# Altium schematic sheet PFC-Sheet.SchDoc (part 4 of 4)
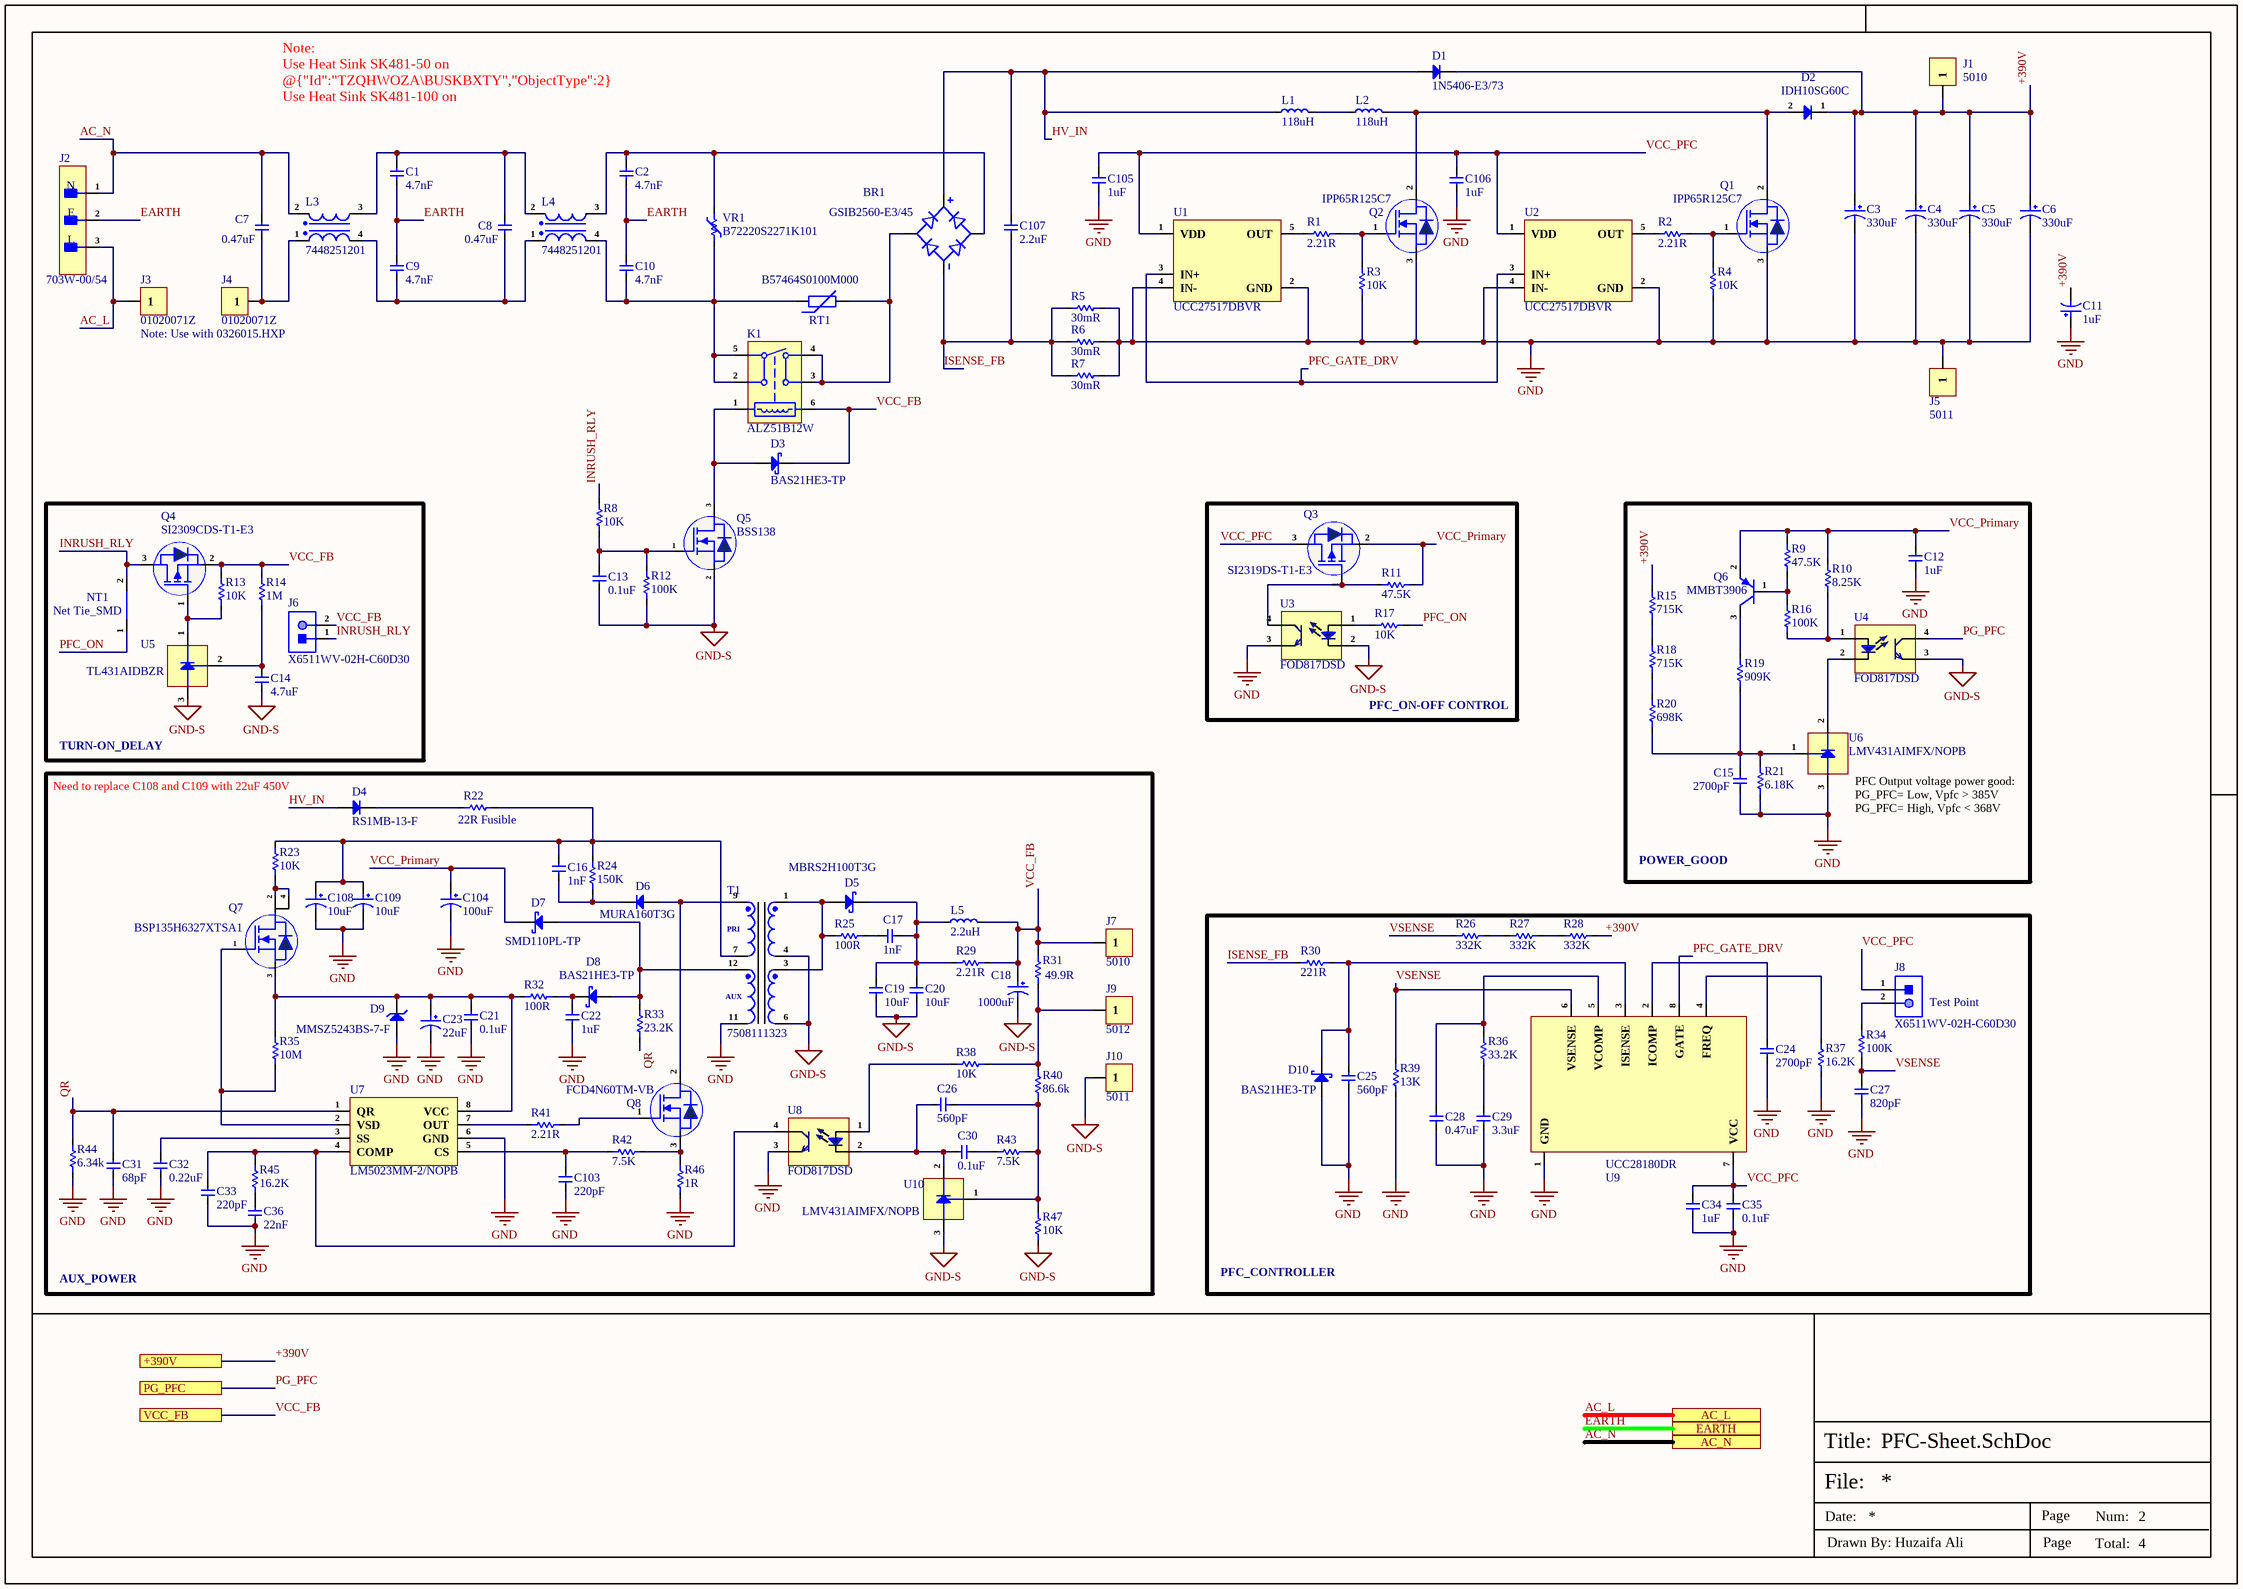
[diagram p3: PFC-Sheet.SchDoc]

## Library data of the parts (continued)
R36 = RC0603FR-0733K2L: RES 33.2K OHM 1% 1/10W 0603; Manufacturer: Yageo; Resistance: 33.2kR; Power Rating: 100mW; Voltage Rating: 50V; Temperature Coefficient: 100ppm/°C; Supplier 1: Digi-Key; Manufacturer Part Number: RC0603FR-0733K2L; RoHS: Yes; Category: Chip SMD Resistors; Stock 1: 1293262; Pricing 1: 1=0.10000, 10=0.02300, 100=0.00930, 1000=0.00417, 2500=0.00362 (USD); Mount: Surface Mount; Case/Package: 0603; Case Code (Imperial): 0603; Case Code (Metric): 1608; Size Code: 0603; Min Operating Temperature: -55°C; Max Operating Temperature: 155°C; Tolerance: 1%; Packaging: Tape and Reel; Termination: SMD/SMT; Resistor Type: Thick Film; Voltage Rating (DC): 50V; Features: Moisture Resistant; Series: RC; Max Power Dissipation: 100mW; Number of Terminations: 2; Construction: Rectangular; Technology: THICK FILM; Length: 1.6mm; Height: 0.45mm; Depth: 0.8mm; Military Standard: Not; Lead Free: Lead Free; RoHS Compliant: Yes; ComponentLink1URL: https://datasheet.ciiva.com/11808/0900766b80f96399-11808316.pdf?src-supplier=RSComponents; ComponentLink1Description: https://datasheet.ciiva.com/11808/0900766b80f96399-11808316.pdf?src-supplier=RSComponents; Supplier Part Number 1: 311-33.2KHRCT-ND; LCSC Part Number: C185338
R37 R45 = CRCW060316K2FKEA: RES SMD 16.2K OHM 1% 1/10W 0603; Manufacturer: Vishay; Item Type: Resistors; Voltage Rating (DC): 75V; Supplier: Mouser; LCSC Part Number: C844531; Manufacturer Part Number: CRCW060316K2FKEA; RoHS: Yes; Stock: 14717; Pricing: 1=0.1, 10=0.016, 50=0.016, 100=0.01, 1000=0.008, 5000=0.005, 10000=0.004, 50000=0.003 (USD); Lead Free: 5697LeadFree; ComponentLink1URL: https://datasheet.ciiva.com/11810/0900766b80d98afc-11810432.pdf?src-supplier=Rs; ComponentLink1Description: https://datasheet.ciiva.com/11810/0900766b80d98afc-11810432.pdf?src-supplier=Rs; ComponentLink2URL: https://datasheet.ciiva.com/2513/dcrcwe3-2513620.pdf?src-supplier=Digikey; ComponentLink2Description: https://datasheet.ciiva.com/2513/dcrcwe3-2513620.pdf?src-supplier=Digikey; ComponentLink3URL: https://datasheet.ciiva.com/2513/dcrcwe3-2513621.pdf?src-supplier=Digikey; ComponentLink3Description: https://datasheet.ciiva.com/2513/dcrcwe3-2513621.pdf?src-supplier=Digikey; ComponentLink4URL: https://datasheet.ciiva.com/2513/dcrcwe3-2513622.pdf?src-supplier=Digikey; ComponentLink4Description: https://datasheet.ciiva.com/2513/dcrcwe3-2513622.pdf?src-supplier=Digikey; ComponentLink5URL: https://datasheet.ciiva.com/3257/dcrcwe3-3257083.pdf?src-supplier=Avnet; ComponentLink5Description: https://datasheet.ciiva.com/3257/dcrcwe3-3257083.pdf?src-supplier=Avnet; ComponentLink6URL: https://datasheet.ciiva.com/16204/dcrcwe3-16204298.pdf?src-supplier=Future+Electronics; ComponentLink6Description: https://datasheet.ciiva.com/16204/dcrcwe3-16204298.pdf?src-supplier=Future+Electronics; ComponentLink7URL: https://datasheet.ciiva.com/7663/1697337-7663893.pdf?src-supplier=Element14; ComponentLink7Description: https://datasheet.ciiva.com/7663/1697337-7663893.pdf?src-supplier=Element14; ComponentLink8URL: https://datasheet.ciiva.com/7173/1635184-7173002.pdf?src-supplier=Newark; ComponentLink8Description: https://datasheet.ciiva.com/7173/1635184-7173002.pdf?src-supplier=Newark; ComponentLink9URL: https://datasheet.ciiva.com/22702/1697337-22702885.pdf?src-supplier=Element14; ComponentLink9Description: https://datasheet.ciiva.com/22702/1697337-22702885.pdf?src-supplier=Element14; ComponentLink10URL: https://datasheet.ciiva.com/16787/70201119-16787821.pdf?src-supplier=Allied+Electronics; ComponentLink10Description: https://datasheet.ciiva.com/16787/70201119-16787821.pdf?src-supplier=Allied+Electronics; ComponentLink11URL: https://datasheet.ciiva.com/22869/70201119-22869438.pdf?src-supplier=Allied+Electronics; ComponentLink11Description: https://datasheet.ciiva.com/22869/70201119-22869438.pdf?src-supplier=Allied+Electronics; ComponentLink12URL: https://datasheet.ciiva.com/5548/dcrcwe3-109170-5548517.pdf?src-supplier=Mouser; ComponentLink12Description: https://datasheet.ciiva.com/5548/dcrcwe3-109170-5548517.pdf?src-supplier=Mouser; ComponentLink13URL: https://datasheet.ciiva.com/7792/125364-7792056.pdf?src-supplier=Element14; ComponentLink13Description: https://datasheet.ciiva.com/7792/125364-7792056.pdf?src-supplier=Element14
R39 = 0603WAF1302T5E: 100mW Thick Film Resistors ±100ppm/℃ ±1% 13kΩ 0603 Chip Resistor - Surface Mount ROHS; Manufacturer: UNI-ROYAL; Manufacturer Part Number: 0603WAF1302T5E; Package: 0603; LCSC Part Number: C22797; Item Type: Resistor; ComponentLink1Description: LCSC; ComponentLink1URL: https://www.lcsc.com/product-detail/Chip-Resistor-Surface-Mount_UNI-ROYAL-Uniroyal-Elec-0603WAF1302T5E_C22797.html
R40 = CRCW060386K6FKEA: RES SMD 86.6K OHM 1% 1/10W 0603; Manufacturer: Vishay; Item Type: Resistors; Value: 86.6kR; Power Rating: 100mW; Voltage Rating: 75V; Temperature Coefficient: 100ppm/°C; Supplier: Mouser; LCSC Part Number: C2076678; Manufacturer Part Number: CRCW060386K6FKEA; RoHS: Yes; Stock: 21228; Pricing: 1=0.1, 10=0.017, 50=0.017, 100=0.01, 1000=0.008, 10000=0.004 (USD); Case/Package: 0603; Pins: 2; Weight: 7.1E-05oz; Case Code (Metric): 1608; Case Code (Imperial): 0603; Contact Plating: Tin; Min Operating Temperature: -55°C; Max Operating Temperature: 155°C; Tolerance: 1%; Packaging: Tape and Reel; Package Quantity: 5000; Number of Terminations: 2; Termination: SMD/SMT; Max Power Dissipation: 100mW; Features: Automotive AEC-Q200; Series: CRCW; Resistor Type: Thick Film; Construction: Rectangular; Technology: THICK FILM; Resistance Tolerance: 1%; Voltage Rating (DC): 75V; Length: 1.55mm; Width: 0.85mm; Height: 0.45mm; Depth: 0.85mm; Ratings: AEC-Q200; Radiation Hardening: No; RoHS Compliant: Yes; Lead Free: 5697LeadFree; Military Standard: Not; Reach SVHC Compliant: Unknown; ComponentLink1URL: https://datasheet.ciiva.com/11812/0900766b80d98afc-11812181.pdf?src-supplier=Rs; ComponentLink1Description: https://datasheet.ciiva.com/11812/0900766b80d98afc-11812181.pdf?src-supplier=Rs; ComponentLink2URL: https://datasheet.ciiva.com/2466/dcrcwe3-2466293.pdf?src-supplier=Digikey; ComponentLink2Description: https://datasheet.ciiva.com/2466/dcrcwe3-2466293.pdf?src-supplier=Digikey; ComponentLink3URL: https://datasheet.ciiva.com/16779/70201119-16779662.pdf?src-supplier=Allied+Electronics; ComponentLink3Description: https://datasheet.ciiva.com/16779/70201119-16779662.pdf?src-supplier=Allied+Electronics; ComponentLink4URL: https://datasheet.ciiva.com/22869/70201119-22869020.pdf?src-supplier=Allied+Electronics; ComponentLink4Description: https://datasheet.ciiva.com/22869/70201119-22869020.pdf?src-supplier=Allied+Electronics; ComponentLink5URL: https://datasheet.ciiva.com/5549/dcrcwe3-109170-5549565.pdf?src-supplier=Mouser; ComponentLink5Description: https://datasheet.ciiva.com/5549/dcrcwe3-109170-5549565.pdf?src-supplier=Mouser; ComponentLink6URL: https://datasheet.ciiva.com/2466/dcrcwe3-2466294.pdf?src-supplier=Digikey; ComponentLink6Description: https://datasheet.ciiva.com/2466/dcrcwe3-2466294.pdf?src-supplier=Digikey; ComponentLink7URL: https://datasheet.ciiva.com/2466/dcrcwe3-2466295.pdf?src-supplier=Digikey; ComponentLink7Description: https://datasheet.ciiva.com/2466/dcrcwe3-2466295.pdf?src-supplier=Digikey; ComponentLink8URL: https://datasheet.ciiva.com/3257/dcrcwe3-3257941.pdf?src-supplier=Avnet; ComponentLink8Description: https://datasheet.ciiva.com/3257/dcrcwe3-3257941.pdf?src-supplier=Avnet; ComponentLink9URL: https://datasheet.ciiva.com/8337/dcrcwe3-8337688.pdf?src-supplier=Avnet; ComponentLink9Description: https://datasheet.ciiva.com/8337/dcrcwe3-8337688.pdf?src-supplier=Avnet; ComponentLink10URL: https://datasheet.ciiva.com/16435/dcrcw-16435963.pdf?src-supplier=Future+Electronics; ComponentLink10Description: https://datasheet.ciiva.com/16435/dcrcw-16435963.pdf?src-supplier=Future+Electronics
R42 = CRCW06037K50FKEA: RES SMD 7.5K OHM 1% 1/10W 0603; Manufacturer: Vishay; Item Type: Resistor; Value: 7.5kR; Temperature Coefficient: 100ppm/°C; Max Power Dissipation: 100mW; Voltage Rating: 75V; Supplier: Mouser; LCSC Part Number: C844808; Manufacturer Part Number: CRCW06037K50FKEA; RoHS: Yes; Stock: 12180; Pricing: 1=0.1, 10=0.017, 50=0.017, 100=0.01, 1000=0.008, 10000=0.004 (USD); Case/Package: 0603; Case Code (Metric): 1608; Case Code (Imperial): 0603; Contact Plating: Tin; Weight: 7.1E-05oz; Min Operating Temperature: -55°C; Max Operating Temperature: 155°C; Tolerance: 1%; Packaging: Tape and Reel; Package Quantity: 5000; Number of Terminations: 2; Features: Automotive AEC-Q200; Series: CRCW; Resistor Type: Thick Film; Power Rating: 100mW; Termination: SMD/SMT; Technology: THICK FILM; Construction: Rectangular; Resistance Tolerance: 1%; Voltage Rating (DC): 75V; Length: 1.55mm; Width: 0.85mm; Height: 0.45mm; Depth: 0.85mm; Ratings: AEC-Q200; Radiation Hardening: No; Lead Free: 5697LeadFree; RoHS Compliant: Yes; Military Standard: Not; Reach SVHC Compliant: Unknown; ComponentLink1URL: https://datasheet.ciiva.com/11810/0900766b80d98afc-11810928.pdf?src-supplier=Rs; ComponentLink1Description: https://datasheet.ciiva.com/11810/0900766b80d98afc-11810928.pdf?src-supplier=Rs; ComponentLink2URL: https://datasheet.ciiva.com/26314/fld-crcw-e3-data-en-26314746.pdf?src-supplier=Distrelec; ComponentLink2Description: https://datasheet.ciiva.com/26314/fld-crcw-e3-data-en-26314746.pdf?src-supplier=Distrelec; ComponentLink3URL: https://datasheet.ciiva.com/7679/1697337-7679146.pdf?src-supplier=Element14; ComponentLink3Description: https://datasheet.ciiva.com/7679/1697337-7679146.pdf?src-supplier=Element14; ComponentLink4URL: https://datasheet.ciiva.com/2465/dcrcwe3-2465715.pdf?src-supplier=Digikey; ComponentLink4Description: https://datasheet.ciiva.com/2465/dcrcwe3-2465715.pdf?src-supplier=Digikey; ComponentLink5URL: https://datasheet.ciiva.com/2465/dcrcwe3-2465716.pdf?src-supplier=Digikey; ComponentLink5Description: https://datasheet.ciiva.com/2465/dcrcwe3-2465716.pdf?src-supplier=Digikey; ComponentLink6URL: https://datasheet.ciiva.com/2465/dcrcwe3-2465714.pdf?src-supplier=Digikey; ComponentLink6Description: https://datasheet.ciiva.com/2465/dcrcwe3-2465714.pdf?src-supplier=Digikey; ComponentLink7URL: https://datasheet.ciiva.com/16774/70201119-16774541.pdf?src-supplier=Allied+Electronics; ComponentLink7Description: https://datasheet.ciiva.com/16774/70201119-16774541.pdf?src-supplier=Allied+Electronics; ComponentLink8URL: https://datasheet.ciiva.com/5544/dcrcwe3-109170-5544283.pdf?src-supplier=Mouser; ComponentLink8Description: https://datasheet.ciiva.com/5544/dcrcwe3-109170-5544283.pdf?src-supplier=Mouser; ComponentLink9URL: https://datasheet.ciiva.com/3257/dcrcwe3-3257903.pdf?src-supplier=Avnet; ComponentLink9Description: https://datasheet.ciiva.com/3257/dcrcwe3-3257903.pdf?src-supplier=Avnet; ComponentLink10URL: https://datasheet.ciiva.com/16389/dcrcw-16389894.pdf?src-supplier=Future+Electronics; ComponentLink10Description: https://datasheet.ciiva.com/16389/dcrcw-16389894.pdf?src-supplier=Future+Electronics; ComponentLink11URL: https://datasheet.ciiva.com/3257/dcrcwe3-3257902.pdf?src-supplier=Avnet; ComponentLink11Description: https://datasheet.ciiva.com/3257/dcrcwe3-3257902.pdf?src-supplier=Avnet
R43 = RT0603BRD077K5L: RES SMD 7.5K OHM 0.1% 1/10W 0603; Manufacturer: Yageo; Resistance: 7.5kR; Power Rating: 100mW; Voltage Rating: 75V; Temperature Coefficient: 25ppm/°C; Voltage Rating (DC): 50V; Item Type: Resistor; Supplier 1: Avnet; Manufacturer Part Number: RT0603BRD077K5L; RoHS: Yes; Category: Chip SMD Resistors; Stock 1: 30000; Pricing 1: 5000=0.02327, 10000=0.02294, 20000=0.02227 (USD); Case/Package: 0603; Case Code (Imperial): 0603; Case Code (Metric): 1608; Weight: 7.1E-05oz; Contact Plating: Tin,Matte; Size Code: 0603; Min Operating Temperature: -55°C; Max Operating Temperature: 125°C; Package Quantity: 5000; Packaging: Tape and Reel; Tolerance: 0.1%; Resistor Type: Thin Film; Termination: SMD/SMT; Number of Terminations: 2; Max Power Dissipation: 100mW; Features: Moisture Resistant; Series: RT; Length: 0.063inch; Width: 0.8mm; Height: 0.022inch; Radiation Hardening: No; Lead Free: Lead Free; RoHS Compliant: Yes; ComponentLink1URL: https://datasheet.ciiva.com/8891/pyu-rt-1-to-0-05-rohs-l-4-8891914.pdf?src-supplier=Avnet; ComponentLink1Description: https://datasheet.ciiva.com/8891/pyu-rt-1-to-0-05-rohs-l-4-8891914.pdf?src-supplier=Avnet; Supplier Part Number 1: RT0603BRD077K5L; LCSC Part Number: C728597
R44 = RT0603BRD076K34L: RES SMD 6.34KOHM 0.1% 1/10W 0603; Manufacturer: Yageo; Resistance: 6.34kR; Power Rating: 100mW; Voltage Rating: 75V; Temperature Coefficient: 25ppm/°C; Voltage Rating (DC): 50V; Item Type: Resistor; Supplier 1: Digi-Key; Manufacturer Part Number: RT0603BRD076K34L; RoHS: Yes; Category: Chip SMD Resistors; Stock 1: 15385; Pricing 1: 1=0.34000, 10=0.28800, 100=0.11260, 500=0.06812, 1000=0.04716, 2500=0.04322 (USD); Case/Package: 0603; Case Code (Imperial): 0603; Case Code (Metric): 1608; Weight: 7.1E-05oz; Min Operating Temperature: -55°C; Max Operating Temperature: 125°C; Packaging: Tape and Reel; Tolerance: 0.1%; Termination: SMD/SMT; Series: RT; Length: 1.6mm; Width: 0.8mm; Height: 0.45mm; Lead Free: Lead Free; RoHS Compliant: Yes; ComponentLink1URL: https://datasheet.ciiva.com/12811/pyu-rt-1-to-0-05-rohs-l-4-12811741.pdf?src-supplier=Mouser; ComponentLink1Description: https://datasheet.ciiva.com/12811/pyu-rt-1-to-0-05-rohs-l-4-12811741.pdf?src-supplier=Mouser; LCSC Part Number: C861532; Supplier Part Number 1: YAG4590CT-ND
R46 = CRCW12061R00FKEA: RES SMD 1 OHM 1% 1/4W 1206; Manufacturer: Vishay; Item Type: Resistor; Voltage Rating (DC): 200V; Supplier: Mouser; LCSC Part Number: C844870; Manufacturer Part Number: CRCW12061R00FKEA; RoHS: Yes; Stock: 28572; Pricing: 1=0.12, 10=0.037, 50=0.037, 100=0.024, 1000=0.021, 10000=0.013 (USD); Lead Free: 5697LeadFree; ComponentLink1URL: https://datasheet.ciiva.com/11811/0900766b80d98b5e-11811443.pdf?src-supplier=Rs; ComponentLink1Description: https://datasheet.ciiva.com/11811/0900766b80d98b5e-11811443.pdf?src-supplier=Rs; ComponentLink2URL: https://datasheet.ciiva.com/5548/dcrcwe3-109170-5548686.pdf?src-supplier=Mouser; ComponentLink2Description: https://datasheet.ciiva.com/5548/dcrcwe3-109170-5548686.pdf?src-supplier=Mouser; ComponentLink3URL: https://datasheet.ciiva.com/16724/70201119-16724205.pdf?src-supplier=Allied+Electronics; ComponentLink3Description: https://datasheet.ciiva.com/16724/70201119-16724205.pdf?src-supplier=Allied+Electronics; ComponentLink4URL: https://datasheet.ciiva.com/7841/1720486-7841869.pdf?src-supplier=Element14; ComponentLink4Description: https://datasheet.ciiva.com/7841/1720486-7841869.pdf?src-supplier=Element14; ComponentLink5URL: https://datasheet.ciiva.com/16295/dcrcwe3-16295679.pdf?src-supplier=Future+Electronics; ComponentLink5Description: https://datasheet.ciiva.com/16295/dcrcwe3-16295679.pdf?src-supplier=Future+Electronics; ComponentLink6URL: https://datasheet.ciiva.com/2468/dcrcwe3-2468799.pdf?src-supplier=Digikey; ComponentLink6Description: https://datasheet.ciiva.com/2468/dcrcwe3-2468799.pdf?src-supplier=Digikey; ComponentLink7URL: https://datasheet.ciiva.com/2468/dcrcwe3-2468800.pdf?src-supplier=Digikey; ComponentLink7Description: https://datasheet.ciiva.com/2468/dcrcwe3-2468800.pdf?src-supplier=Digikey; ComponentLink8URL: https://datasheet.ciiva.com/2468/dcrcwe3-2468801.pdf?src-supplier=Digikey; ComponentLink8Description: https://datasheet.ciiva.com/2468/dcrcwe3-2468801.pdf?src-supplier=Digikey; ComponentLink9URL: https://datasheet.ciiva.com/9109/dcrcwe3-9109199.pdf?src-supplier=Avnet; ComponentLink9Description: https://datasheet.ciiva.com/9109/dcrcwe3-9109199.pdf?src-supplier=Avnet
RT1 = B57464S0100M000: ICL 10 OHM 20% 8A 26MM; Manufacturer: TDK EPCOS; Item Type: THermistor; Supplier: Digikey; Supplier Part Number: 495-4111-ND; Manufacturer Part Number: B57464S0100M000; RoHS: Yes; Pricing: 1=5.3, 5=4.42, 10=4.087, 50=3.4022, 200=2.9015, 400=2.6778, 600=2.5544, 1000=2.50812 (USD); ComponentLink1URL: https://datasheet.ciiva.com/46435/1795241-46435759.pdf?src-supplier=Element14; ComponentLink1Description: https://datasheet.ciiva.com/46435/1795241-46435759.pdf?src-supplier=Element14; ComponentLink2URL: https://datasheet.ciiva.com/7982/1795241-7982525.pdf?src-supplier=Element14; ComponentLink2Description: https://datasheet.ciiva.com/7982/1795241-7982525.pdf?src-supplier=Element14
T1 = 7508111323: XFMR FLYBACK AC/DC CONV 2MH TH; Manufacturer: Wurth Electronics; Item Type: Transformer; Supplier: Digikey; Supplier Part Number: 732-7508111323CT-ND; Manufacturer Part Number: 7508111323; RoHS: No; Stock: 130; Pricing: 1=6.34, 25=6.3092, 50=5.735 (USD)
U1 U2 = UCC27517DBVR: IC GATE DRVR LOW-SIDE SOT23-5; Manufacturer: Texas Instruments; Operating Supply Voltage: 12V; Number of Outputs: 1; Max Supply Voltage: 18V; Min Supply Voltage: 4.5V; Rise Time: 22ns; Propagation Delay: 30ns; Output Current: 4A; Channel Type: Single; Fall Time: 11ns; Supplier: Mouser; LCSC Part Number: C99395; Manufacturer Part Number: UCC27517DBVR; RoHS: Yes; Item Type: IC; Stock: 71094; Pricing: 1=0.77, 10=0.646, 50=0.646, 100=0.501, 1000=0.346, 10000=0.29 (USD); Mounting Technology: Surface Mount; Case/Package: SOT-23-5; Pins: 5; Min Operating Temperature: -40°C; Max Operating Temperature: 140°C; Packaging: Tape and Reel; Package Quantity: 3000; Max Output current: 4A; Number of Drivers: 1; Turn-On Delay Time: 30ns; Number of Channels: 1; Series: -; Length: 2.9mm; Width: 1.6mm; Height: 1.45mm; Thickness: 1.2mm; Radiation Hardening: No; Lead Free: Lead Free; RoHS Compliant: Yes; ComponentLink1URL: http://components.arrow.com/part/dataview/52526194S5756N7713?src-supplier=Arrow+Electronics; ComponentLink1Description: http://components.arrow.com/part/dataview/52526194S5756N7713?src-supplier=Arrow+Electronics; ComponentLink2URL: http://www.ti.com/lit/ds/symlink/ucc27517.pdf?src-supplier=Avnet; ComponentLink2Description: http://www.ti.com/lit/ds/symlink/ucc27517.pdf?src-supplier=Avnet; ComponentLink3URL: http://www.ti.com/lit/ds/symlink/ucc27517.pdf?src-supplier=Digikey; ComponentLink3Description: http://www.ti.com/lit/ds/symlink/ucc27517.pdf?src-supplier=Digikey; ComponentLink4URL: http://www.ti.com/lit/gpn/ucc27517?src-supplier=Mouser; ComponentLink4Description: http://www.ti.com/lit/gpn/ucc27517?src-supplier=Mouser; ComponentLink5URL: http://www.ti.com/general/docs/lit/getliterature.tsp?genericPartNumber=UCC27516&&fileType=pdf&src-supplier=Avnet; ComponentLink5Description: http://www.ti.com/general/docs/lit/getliterature.tsp?genericPartNumber=UCC27516&&fileType=pdf&src-supplier=Avnet; ComponentLink6URL: https://www.verical.com/server-webapp/html/getDatasheet?partID=482756&src-supplier=Verical; ComponentLink6Description: https://www.verical.com/server-webapp/html/getDatasheet?partID=482756&src-supplier=Verical
U3 U4 U8 = FOD817DSD: OPTOISOLATOR 5KV TRANSISTOR 4SMD; Manufacturer: ON Semiconductor / Fairchild; Item Type: Optocouplers; Supplier: Future Electronics; LCSC Part Number: C241832; Manufacturer Part Number: FOD817DSD; RoHS: Yes; Stock: 194000; Pricing: 1000=0.153, 3000=0.148, 5000=0.146, 15000=0.142, 25000=0.138 (USD); ComponentLink1URL: https://datasheet.ciiva.com/2085/fod817-2085872.pdf?src-supplier=Digikey; ComponentLink1Description: https://datasheet.ciiva.com/2085/fod817-2085872.pdf?src-supplier=Digikey; ComponentLink2URL: https://datasheet.ciiva.com/30520/2018343-30520890.pdf?src-supplier=Jameco; ComponentLink2Description: https://datasheet.ciiva.com/30520/2018343-30520890.pdf?src-supplier=Jameco; ComponentLink3URL: https://datasheet.ciiva.com/15118/getdatasheetpartid-110546-15118613.pdf?src-supplier=Verical; ComponentLink3Description: https://datasheet.ciiva.com/15118/getdatasheetpartid-110546-15118613.pdf?src-supplier=Verical; ComponentLink4URL: https://datasheet.ciiva.com/2085/fod817d-2085873.pdf?src-supplier=Digikey; ComponentLink4Description: https://datasheet.ciiva.com/2085/fod817d-2085873.pdf?src-supplier=Digikey; ComponentLink5URL: https://datasheet.ciiva.com/2085/fod817d-2085874.pdf?src-supplier=Digikey; ComponentLink5Description: https://datasheet.ciiva.com/2085/fod817d-2085874.pdf?src-supplier=Digikey; ComponentLink6URL: https://datasheet.ciiva.com/8095/fod817d-8095134.pdf?src-supplier=Avnet; ComponentLink6Description: https://datasheet.ciiva.com/8095/fod817d-8095134.pdf?src-supplier=Avnet; ComponentLink7URL: https://datasheet.ciiva.com/17277/fod817-17277350.pdf?src-supplier=Future+Electronics; ComponentLink7Description: https://datasheet.ciiva.com/17277/fod817-17277350.pdf?src-supplier=Future+Electronics
U5 = TL431AIDBZR: IC VREF SHUNT ADJ 1% SOT23-3; Manufacturer: Texas Instruments; Output Voltage: 36V; Number of Channels: 1; Cathode Current: 700uA; Output Current: 100mA; Reference Type: Shunt,Adjustable; Min Input Voltage: 2.495V; Max Supply Voltage: 37V; Temperature Coefficient: 92ppm/°C; Output Type: Adjustable; Supplier: Mouser; LCSC Part Number: C23892; Manufacturer Part Number: TL431AIDBZR; RoHS: Yes; Item Type: IC; Stock: 732677; Pricing: 1=0.25, 10=0.142, 50=0.142, 100=0.099, 1000=0.095, 10000=0.08 (USD); Case/Package: SOT-23; Pins: 3; Min Operating Temperature: -40°C; Max Operating Temperature: 125°C; Packaging: Tape and Reel; Package Quantity: 1; Tolerance: 1%; Reference Voltage: 36V; Series: -; Max Output current: 100mA; Min Output Voltage: 2.495V; Max Output Voltage: 36V; Radiation Hardening: No; Lead Free: Lead Free; RoHS Compliant: Yes; Reach SVHC Compliant: No; ComponentLink1URL: https://datasheet.ciiva.com/3235/tl432b-3235600.pdf?src-supplier=Avnet; ComponentLink1Description: https://datasheet.ciiva.com/3235/tl432b-3235600.pdf?src-supplier=Avnet; ComponentLink2URL: https://datasheet.ciiva.com/15148/getdatasheetpartid-171576-15148968.pdf?src-supplier=Verical; ComponentLink2Description: https://datasheet.ciiva.com/15148/getdatasheetpartid-171576-15148968.pdf?src-supplier=Verical; ComponentLink3URL: https://datasheet.ciiva.com/41462/001014548-da-01-en-ic-vref-shunt-prec-tl431aidbzr-sot-3-tid-41462400.pdf?src-supplier=Conrad; ComponentLink3Description: https://datasheet.ciiva.com/41462/001014548-da-01-en-ic-vref-shunt-prec-tl431aidbzr-sot-3-tid-41462400.pdf?src-supplier=Conrad; ComponentLink4URL: https://datasheet.ciiva.com/46397/1887475-46397705.pdf?src-supplier=Element14; ComponentLink4Description: https://datasheet.ciiva.com/46397/1887475-46397705.pdf?src-supplier=Element14; ComponentLink5URL: https://datasheet.ciiva.com/2006/tl431a-2006188.pdf?src-supplier=Digikey; ComponentLink5Description: https://datasheet.ciiva.com/2006/tl431a-2006188.pdf?src-supplier=Digikey; ComponentLink6URL: https://datasheet.ciiva.com/2006/tl431a-2006187.pdf?src-supplier=Digikey; ComponentLink6Description: https://datasheet.ciiva.com/2006/tl431a-2006187.pdf?src-supplier=Digikey; ComponentLink7URL: https://datasheet.ciiva.com/2006/tl431a-2006189.pdf?src-supplier=Digikey; ComponentLink7Description: https://datasheet.ciiva.com/2006/tl431a-2006189.pdf?src-supplier=Digikey
U6 U10 = LMV431AIMFX/NOPB: IC VREF SHUNT ADJ 1% SOT23-3; Manufacturer: TI National Semiconductor; Supplier: Mouser; LCSC Part Number: C478069; Manufacturer Part Number: LMV431AIMFX/NOPB; RoHS: Yes; Item Type: IC; Stock: 22360; Pricing: 1=0.68, 10=0.561, 50=0.561, 100=0.425, 1000=0.29, 10000=0.24 (USD); ComponentLink1URL: https://datasheet.ciiva.com/2012/lmv431-2012949.pdf?src-supplier=Digikey; ComponentLink1Description: https://datasheet.ciiva.com/2012/lmv431-2012949.pdf?src-supplier=Digikey; ComponentLink2URL: https://datasheet.ciiva.com/2012/lmv431-2012950.pdf?src-supplier=Digikey; ComponentLink2Description: https://datasheet.ciiva.com/2012/lmv431-2012950.pdf?src-supplier=Digikey; ComponentLink3URL: https://datasheet.ciiva.com/6596/lmv431-6596021.pdf?src-supplier=Digikey; ComponentLink3Description: https://datasheet.ciiva.com/6596/lmv431-6596021.pdf?src-supplier=Digikey; ComponentLink4URL: https://datasheet.ciiva.com/46424/1841927-46424699.pdf?src-supplier=Element14; ComponentLink4Description: https://datasheet.ciiva.com/46424/1841927-46424699.pdf?src-supplier=Element14
U7 = LM5023MM-2/NOPB: IC OFFLINE SWITCH FLYBACK 8VSSOP; Manufacturer: Texas Instruments; Min Supply Voltage: 8V; Max Supply Voltage: 14V; Frequency: 130kHz; Rise Time: 25ns; Number of Outputs: 1; Max Duty Cycle: 50%; Fall Time: 15ns; Operating Supply Current: 800uA; Duty Cycle: 0%; Fault Protection: Over Voltage; Supplier: Mouser; LCSC Part Number: C2871051; Manufacturer Part Number: LM5023MM-2/NOPB; RoHS: Yes; Item Type: IC; Stock: 1589; Pricing: 1=1.17, 10=0.891, 50=0.891, 100=0.811, 1000=0.643, 10000=0.627 (USD); Mounting Technology: Surface Mount; Case/Package: VSSOP; Pins: 8; Min Operating Temperature: -40°C; Max Operating Temperature: 125°C; Packaging: Cut Tape; Switching Frequency: 130kHz; Package Quantity: 1000; Topology: Flyback; Series: -; Nominal Supply Current: 800uA; Length: 3mm; Width: 3mm; Height: 1.07mm; Thickness: 970um; Radiation Hardening: No; Reach SVHC Compliant: No; Lead Free: Lead Free; RoHS Compliant: Yes; ComponentLink1URL: https://datasheet.ciiva.com/23940/1752268-23940537.pdf?src-supplier=Newark; ComponentLink1Description: https://datasheet.ciiva.com/23940/1752268-23940537.pdf?src-supplier=Newark; ComponentLink2URL: https://datasheet.ciiva.com/30018/lm5023-30018293.pdf?src-supplier=Avnet; ComponentLink2Description: https://datasheet.ciiva.com/30018/lm5023-30018293.pdf?src-supplier=Avnet; ComponentLink3URL: https://datasheet.ciiva.com/22748/1804927-22748090.pdf?src-supplier=Element14; ComponentLink3Description: https://datasheet.ciiva.com/22748/1804927-22748090.pdf?src-supplier=Element14; ComponentLink4URL: https://datasheet.ciiva.com/29610/lm5023-29610235.pdf?src-supplier=Digikey; ComponentLink4Description: https://datasheet.ciiva.com/29610/lm5023-29610235.pdf?src-supplier=Digikey; ComponentLink5URL: https://datasheet.ciiva.com/29610/lm5023-29610236.pdf?src-supplier=Digikey; ComponentLink5Description: https://datasheet.ciiva.com/29610/lm5023-29610236.pdf?src-supplier=Digikey; ComponentLink6URL: https://datasheet.ciiva.com/18617/lm5023-18617703.pdf?src-supplier=Digikey; ComponentLink6Description: https://datasheet.ciiva.com/18617/lm5023-18617703.pdf?src-supplier=Digikey; ComponentLink7URL: https://datasheet.ciiva.com/30018/lm5023-30018294.pdf?src-supplier=Avnet; ComponentLink7Description: https://datasheet.ciiva.com/30018/lm5023-30018294.pdf?src-supplier=Avnet
U9 = UCC28180DR: IC PFC CTRLR CCM 250KHZ 8SOIC; Manufacturer: Texas Instruments; Supplier: Mouser; LCSC Part Number: C88567; Manufacturer Part Number: UCC28180DR; RoHS: Yes; Item Type: IC; Stock: 6340; Pricing: 1=1.44, 10=1.29, 50=1.29, 100=1.01, 1000=0.66, 10000=0.563 (USD); ComponentLink1URL: https://datasheet.ciiva.com/24141/slusbq5a-317155-24141395.pdf?src-supplier=Mouser; ComponentLink1Description: https://datasheet.ciiva.com/24141/slusbq5a-317155-24141395.pdf?src-supplier=Mouser; ComponentLink2URL: https://datasheet.ciiva.com/29899/ucc28180-29899377.pdf?src-supplier=Avnet; ComponentLink2Description: https://datasheet.ciiva.com/29899/ucc28180-29899377.pdf?src-supplier=Avnet
VR1 = B72220S2271K101: VARISTOR 430V 10KA DISC 20MM; Manufacturer: TDK EPCOS; Item Type: Varistors; Value: 630pF; Max Output current: 8kA; Voltage Rating: 350V; Number of Circuits: 1; Max Voltage Rating (AC): 275V; Energy: 215J; Min Varistor Voltage: 387V; Max Varistor Voltage: 473V; Lead/Base Style: Radial; Clamping Current: 100A; Clamping Voltage: 710V; Voltage Tolerance: 10%; Power Rating: 1W; Supplier: Digikey; LCSC Part Number: C210767; Manufacturer Part Number: B72220S2271K101; RoHS: Yes; Stock: 13458; Pricing: 1=1.43, 10=0.901, 25=0.7632, 100=0.6065, 250=0.53008, 500=0.4833, 1000=0.44435, 2500=0.40274, 5000=0.37737 (USD); Mounting Technology: Through Hole; Case/Package: Metal; Material: 4240ConductorMaterial; Weight: 4.000004g; Min Operating Temperature: -40°C; Max Operating Temperature: 85°C; Packaging: Bulk; Max Voltage Rating (DC): 350V; Varistor Voltage: 430V; Max Surge Current: 10kA; Series: AdvanceD; Voltage Rating (AC): 275V; Voltage Rating (DC): 350V; Termination: 4745ConnectorType; Lead Pitch: 10mm; Depth: 5.8mm; Radiation Hardening: 5898YesNo; RoHS Compliant: Yes; Reach SVHC Compliant: Unknown; Flammability Rating: 5813Flammability; Lead Free: 5697LeadFree; ComponentLink1URL: https://datasheet.ciiva.com/28408/1680955-28408747.pdf?src-supplier=Element14; ComponentLink1Description: https://datasheet.ciiva.com/28408/1680955-28408747.pdf?src-supplier=Element14; ComponentLink2URL: https://datasheet.ciiva.com/16417/siov-leaded-advanced-16417989.pdf?src-supplier=Future+Electronics; ComponentLink2Description: https://datasheet.ciiva.com/16417/siov-leaded-advanced-16417989.pdf?src-supplier=Future+Electronics